# Altium schematic sheet BIAS_control.SchDoc: =MainTitle
size 420 x 297 mm; SheetNumber: 10; SheetTotal: 11; EDA_Number: ARTIQ; Projet: ARTIQ/SINARA; ModifiedBy: -; CreateDate: XX/XX/XXXX; CheckedDate: -; Title2: Power Stage; DivGrp: ISE; Designer: shanasz
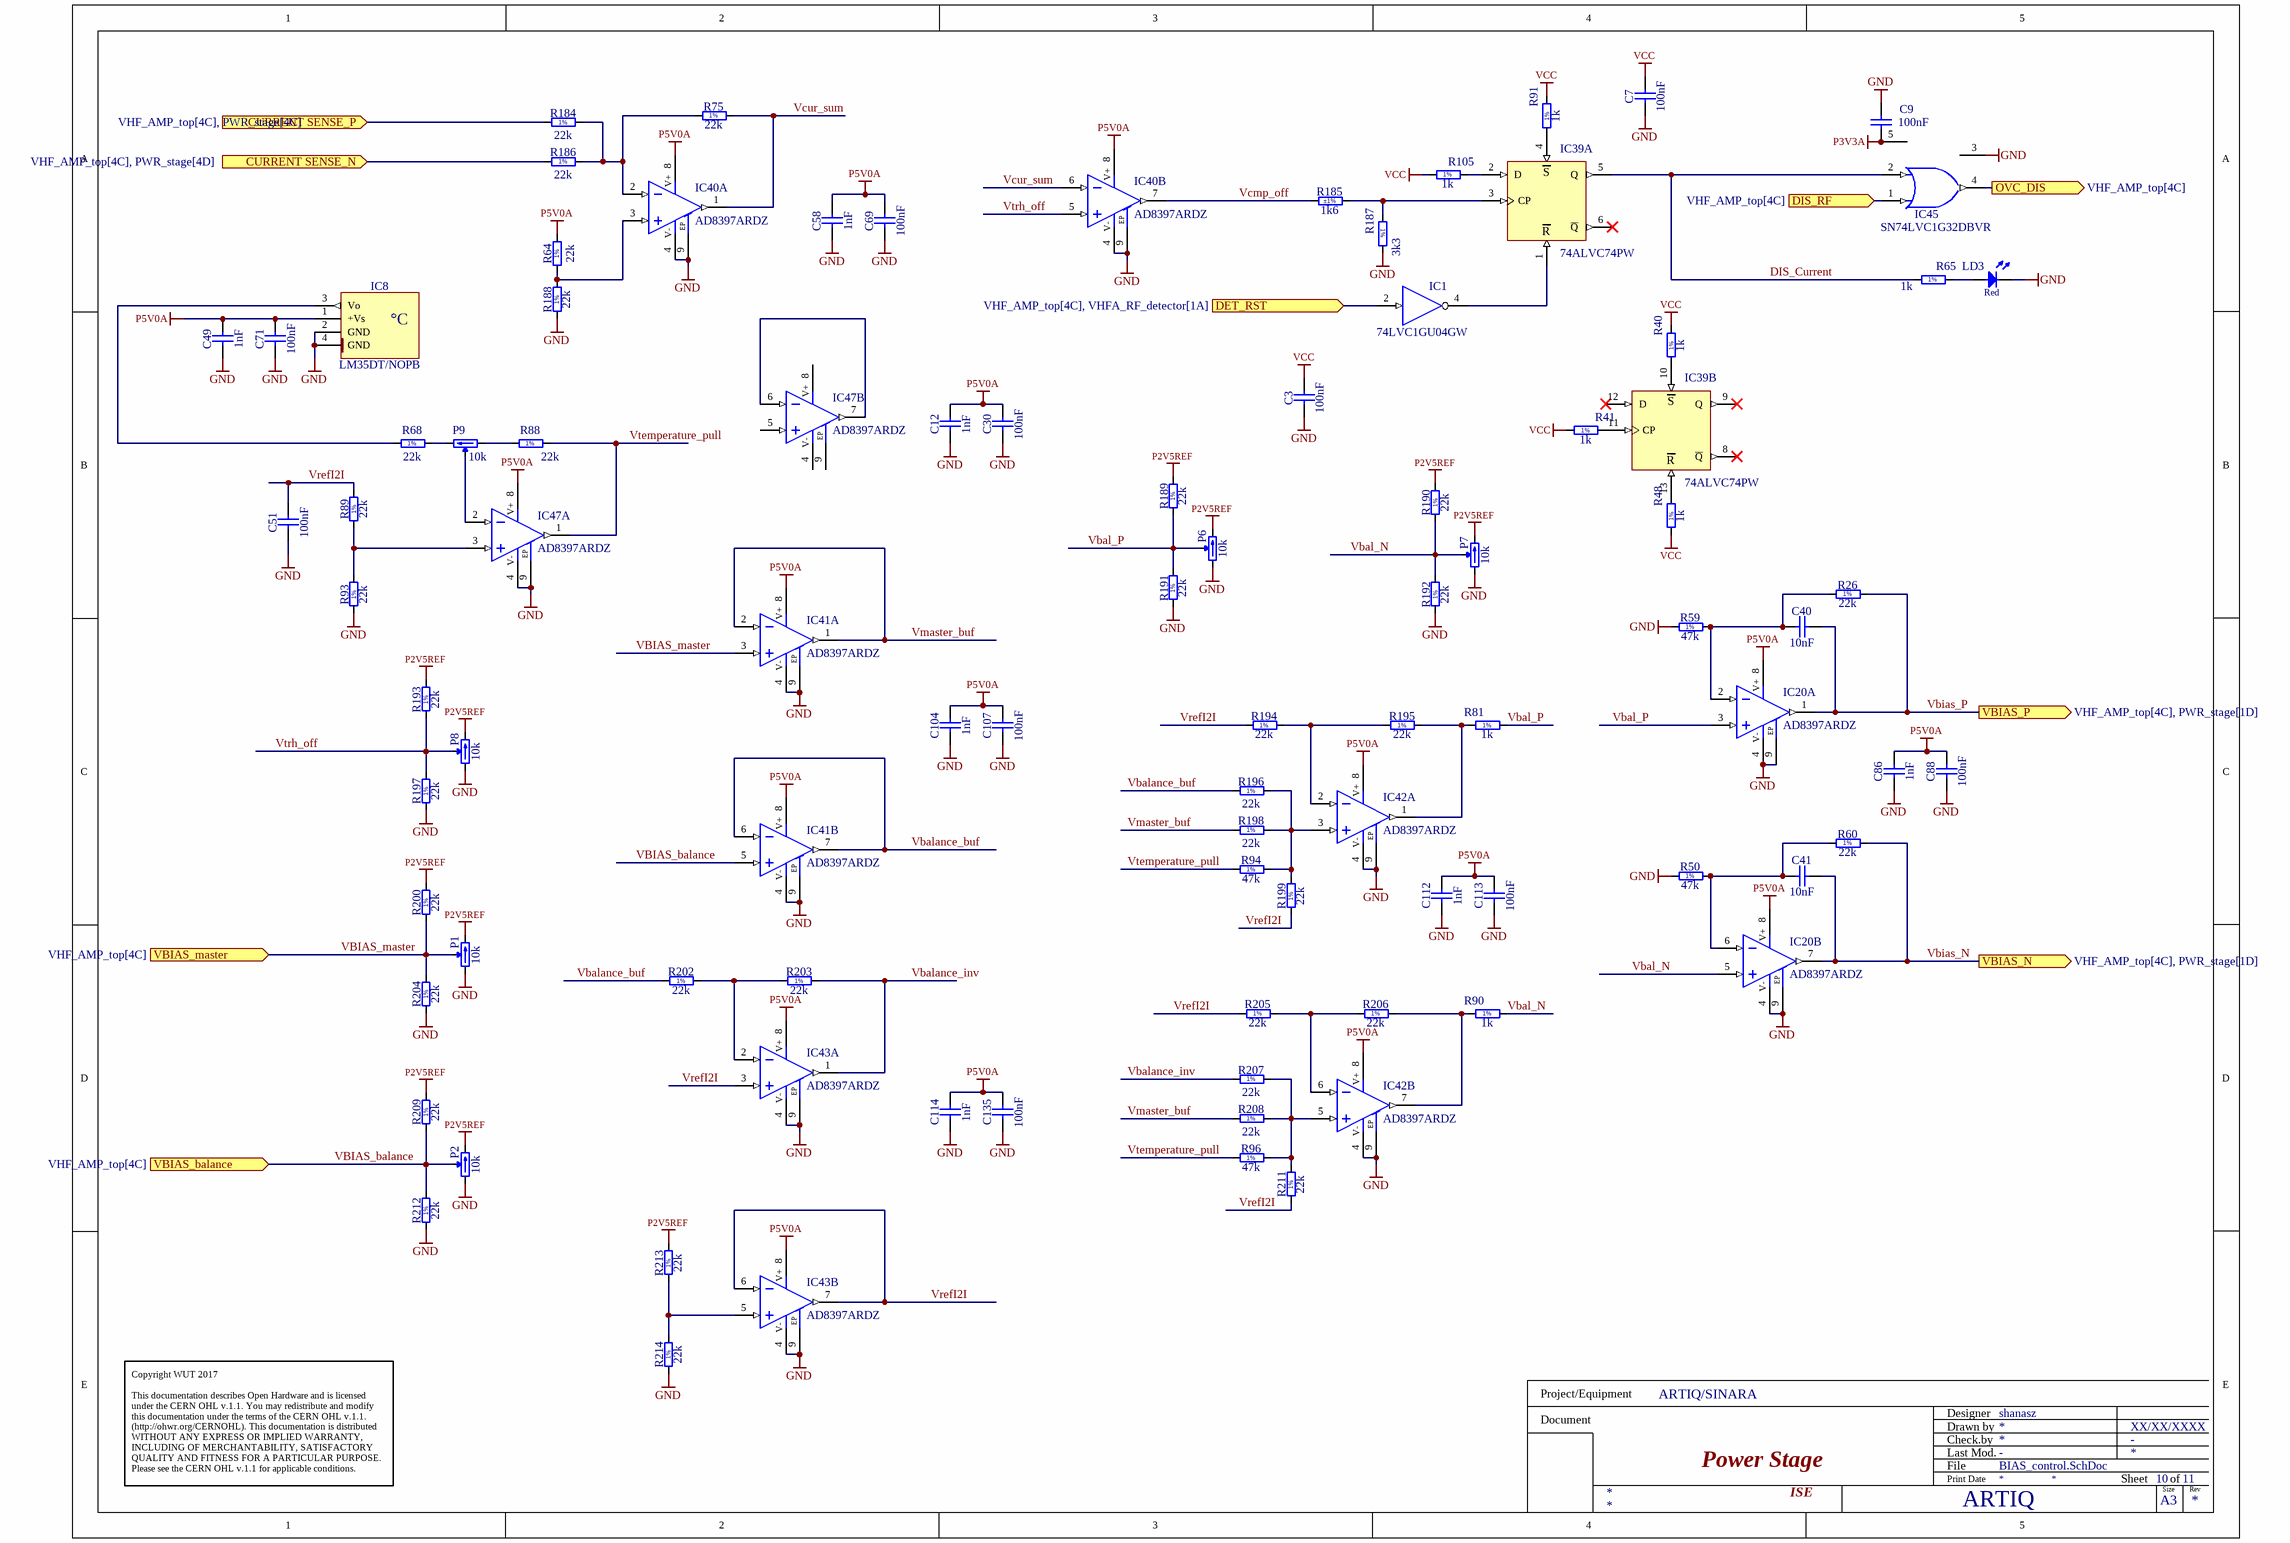
[diagram p0: BIAS_control.SchDoc]

## Parts
C3  100nF  [CAPC1005X55N]
C7  100nF  [CAPC1005X55N]
C9  100nF  [CAPC1005X55N]
C12  1nF  [CAPC1005X55N]
C30  100nF  [CAPC1005X55N]
C40  10nF  [CAPC1005X55N]
C41  10nF  [CAPC1005X55N]
C49  1nF  [CAPC1005X55N]
C51  100nF  [CAPC1005X55N]
C58  1nF  [CAPC1005X55N]
C69  100nF  [CAPC1005X55N]
C71  100nF  [CAPC1005X55N]
C86  1nF  [CAPC1005X55N]
C88  100nF  [CAPC1005X55N]
C104  1nF  [CAPC1005X55N]
C107  100nF  [CAPC1005X55N]
C112  1nF  [CAPC1005X55N]
C113  100nF  [CAPC1005X55N]
C114  1nF  [CAPC1005X55N]
C135  100nF  [CAPC1005X55N]
IC1  74LVC1GU04GW  [SOT65P212X110-5N]
IC8  LM35DT/NOPB  [TO-220-HFLIP]
IC20  AD8397ARDZ  [SOIC127P600X175-9N-R241X309]  (parts A,B of 2)
IC39  74ALVC74PW  [SOP65P640X110-14N]  (parts A,B of 2)
IC40  AD8397ARDZ  [SOIC127P600X175-9N-R241X309]  (parts A,B of 2)
IC41  AD8397ARDZ  [SOIC127P600X175-9N-R241X309]  (parts A,B of 2)
IC42  AD8397ARDZ  [SOIC127P600X175-9N-R241X309]  (parts A,B of 2)
IC43  AD8397ARDZ  [SOIC127P600X175-9N-R241X309]  (parts A,B of 2)
IC45  SN74LVC1G32DBVR  [SOT95P280X145-5N]
IC47  AD8397ARDZ  [SOIC127P600X175-9N-R241X309]  (parts A,B of 2)
LD3  Red  [LED_AVAGO_HSMC-C120]
P1  10k  [TRIM_BOURNS_3224W]
P2  10k  [TRIM_BOURNS_3224W]
P6  10k  [TRIM_BOURNS_3224W]
P7  10k  [TRIM_BOURNS_3224W]
P8  10k  [TRIM_BOURNS_3224W]
P9  10k  [TRIM_BOURNS_3224W]
R26  22k  [RESC1005X40N]
R40  1k  [RESC1005X40N]
R41  1k  [RESC1005X40N]
R48  1k  [RESC1005X40N]
R50  47k  [RESC1005X40N]
R59  47k  [RESC1005X40N]
R60  22k  [RESC1005X40N]
R64  22k  [RESC1005X40N]
R65  1k  [RESC1005X40N]
R68  22k  [RESC1005X40N]
R75  22k  [RESC1005X40N]
R81  1k  [RESC1005X40N]
R88  22k  [RESC1005X40N]
R89  22k  [RESC1005X40N]
R90  1k  [RESC1005X40N]
R91  1k  [RESC1005X40N]
R93  22k  [RESC1005X40N]
R94  47k  [RESC1005X40N]
R96  47k  [RESC1005X40N]
R105  1k  [RESC1005X40N]
R184  22k  [RESC1005X40N]
R185  1k6  Tolerance: ±1%  [RESC1005X40N]
R186  22k  [RESC1005X40N]
R187  3k3  [RESC1005X40N]
R188  22k  [RESC1005X40N]
R189  22k  [RESC1005X40N]
R190  22k  [RESC1005X40N]
R191  22k  [RESC1005X40N]
R192  22k  [RESC1005X40N]
R193  22k  [RESC1005X40N]
R194  22k  [RESC1005X40N]
R195  22k  [RESC1005X40N]
R196  22k  [RESC1005X40N]
R197  22k  [RESC1005X40N]
R198  22k  [RESC1005X40N]
R199  22k  [RESC1005X40N]
R200  22k  [RESC1005X40N]
R202  22k  [RESC1005X40N]
R203  22k  [RESC1005X40N]
R204  22k  [RESC1005X40N]
R205  22k  [RESC1005X40N]
R206  22k  [RESC1005X40N]
R207  22k  [RESC1005X40N]
R208  22k  [RESC1005X40N]
R209  22k  [RESC1005X40N]
R211  22k  [RESC1005X40N]
R212  22k  [RESC1005X40N]
R213  22k  [RESC1005X40N]
R214  22k  [RESC1005X40N]

## Ports
CURRENT SENSE_N (in, see VHF_AMP_top[4C], PWR_stage[4D]), CURRENT SENSE_P (in, see VHF_AMP_top[4C], PWR_stage[4C]), DET_RST (in, see VHF_AMP_top[4C], VHFA_RF_detector[1A]), DIS_RF (in, see VHF_AMP_top[4C]), OVC_DIS (out, see VHF_AMP_top[4C]), VBIAS_balance (in, see VHF_AMP_top[4C]), VBIAS_master (in, see VHF_AMP_top[4C]), VBIAS_N (out, see VHF_AMP_top[4C], PWR_stage[1D]), VBIAS_P (out, see VHF_AMP_top[4C], PWR_stage[1D])

## Nets
GND: C3.1 C7.1 C9.2 C12.1 C30.1 C49.1 C51.1 C58.1 C69.1 C71.1 C86.1 C88.1 C104.1 C107.1 C112.1 C113.1 C114.1 C135.1 IC1.3(GND) IC8.2(GND) IC8.4(GND) IC20.4(V-) IC20.9(Exposed_Pad) IC39.7(GND) IC40.4(V-) IC40.9(Exposed_Pad) IC41.4(V-) IC41.9(Exposed_Pad) IC42.4(V-) IC42.9(Exposed_Pad) IC43.4(V-) IC43.9(Exposed_Pad) IC45.3(GND) IC47.4(V-) IC47.9(Exposed_Pad) LD3.1(C) P1.1(CCW) P2.1(CCW) P6.1(CCW) P7.1(CCW) P8.1(CCW) R50.2 R59.2 R93.2 R187.2 R188.2 R191.2 R192.2 R197.2 R204.2 R212.2 R214.2
P2V5REF: P1.3(CW) P2.3(CW) P6.3(CW) P7.3(CW) P8.3(CW) R189.1 R190.1 R193.1 R200.1 R209.1 R213.1
P3V3A: C9.1 IC45.5(VCC)
P5V0A: C12.2 C30.2 C49.2 C58.2 C69.2 C71.2 C86.2 C88.2 C104.2 C107.2 C112.2 C113.2 C114.2 C135.2 IC8.1(+Vs) IC20.8(V+) IC40.8(V+) IC41.8(V+) IC42.8(V+) IC43.8(V+) IC47.8(V+) R64.1
VCC: C3.2 C7.2 IC39.14(VCC) R40.2 R41.1 R48.1 R91.2 R105.1
VDD: IC1.5(VCC)
CURRENT SENSE_N: R186.2 ; port CURRENT SENSE_N
CURRENT SENSE_P: R184.2 ; port CURRENT SENSE_P
DET_RST: IC1.2(IN) ; port DET_RST
DIS_Current: IC39.5(Q) IC45.2(B) R65.1
DIS_RF: IC45.1(A) ; port DIS_RF
OVC_DIS: IC45.4(Y) ; port OVC_DIS
Vbal_N: IC20.5(IN+) P7.2(W) R90.2 R190.2 R192.1
Vbal_P: IC20.3(IN+) P6.2(W) R81.2 R189.2 R191.1
Vbalance_buf: IC41.6(IN-) IC41.7(OUT) R196.2 R202.2
Vbalance_inv: IC43.1(OUT) R203.1 R207.2
VBIAS_balance: IC41.5(IN+) P2.2(W) R209.2 R212.1 ; port VBIAS_balance
VBIAS_master: IC41.3(IN+) P1.2(W) R200.2 R204.1 ; port VBIAS_master
Vbias_N: C41.2 IC20.7(OUT) R60.1 ; port VBIAS_N
Vbias_P: C40.2 IC20.1(OUT) R26.1 ; port VBIAS_P
Vcmp_off: IC40.7(OUT) R185.1
Vcur_sum: IC40.1(OUT) IC40.6(IN-) R75.1
Vmaster_buf: IC41.1(OUT) IC41.2(IN-) R198.2 R208.2
VrefI2I: C51.2 IC43.3(IN+) IC43.6(IN-) IC43.7(OUT) R89.1 R194.2 R199.2 R205.2 R211.2
Vtemperature_pull: IC47.1(OUT) R88.1 R94.2 R96.2
Vtrh_off: IC40.5(IN+) P8.2(W) R193.2 R197.1
NetC40_1: C40.1 IC20.2(IN-) R26.2 R59.1
NetC41_1: C41.1 IC20.6(IN-) R50.1 R60.2
NetIC1_4: IC1.4(OUT) IC39.1(~{R})
NetIC8_3: IC8.3(Vo) R68.2
NetIC39_2: IC39.2(D) R105.2
NetIC39_3: IC39.3(CP) R185.2 R187.1
NetIC39_4: IC39.4(~{S}) R91.1
NetIC39_10: IC39.10(~{S}) R40.1
NetIC39_11: IC39.11(CP) R41.2
NetIC39_13: IC39.13(~{R}) R48.2
NetIC40_2: IC40.2(IN-) R75.2 R184.1 R186.1
NetIC40_3: IC40.3(IN+) R64.2 R188.1
NetIC42_1: IC42.1(OUT) R81.1 R195.1
NetIC42_2: IC42.2(IN-) R194.1 R195.2
NetIC42_3: IC42.3(IN+) R94.1 R196.1 R198.1 R199.1
NetIC42_5: IC42.5(IN+) R96.1 R207.1 R208.1 R211.1
NetIC42_6: IC42.6(IN-) R205.1 R206.2
NetIC42_7: IC42.7(OUT) R90.1 R206.1
NetIC43_2: IC43.2(IN-) R202.1 R203.2
NetIC43_5: IC43.5(IN+) R213.2 R214.1
NetIC47_2: IC47.2(IN-) P9.2(W)
NetIC47_3: IC47.3(IN+) R89.2 R93.1
NetIC47_6: IC47.6(IN-) IC47.7(OUT)
NetLD3_2: LD3.2(A) R65.2
NetP9_1: P9.1(CCW) R88.2
NetP9_3: P9.3(CW) R68.1

Not connected (* = marked no-connect by the designer): IC39 6(~{Q})* 8(~{Q})* 9(Q)* 12(D)*; IC47 5(IN+)

## Notes on the sheet
- Project/Equipment
- Document
- Designer
- Drawn by
- Check.by
- Copyright WUT 2017
  This documentation describes Open Hardware and is licensed under the CERN OHL v.1.1. You may redistribute and modify this documentation under the terms of the CERN OHL v.1.1. (http://ohwr.org/CERNOHL). This documentation is distributed WITHOUT ANY EXPRESS OR IMPLIED WARRANTY, INCLUDING OF MERCHANTABILITY, SATISFACTORY QUALITY AND FITNESS FOR A PARTICULAR PURPOSE. Please see the CERN OHL v.1.1 for applicable conditions.
- File
- Last Mod.
- Print Date
- Sheet
- Size
- A3
- of
- Rev
- (in symbol 74ALVC74PW, part A) S; R
- (in symbol 74ALVC74PW, part B) S; R
- (in symbol AD8397ARDZ, part A) EP
- (in symbol AD8397ARDZ, part B) EP
- (in symbol LM35DT/NOPB_h) °C
- (in symbol R0402_1K_1%_0.0625W_100PPM) 1%
- (in symbol R0402_3K3_1%_0.0625W_100PPM) 1%
- (in symbol R0402_22K_1%_0.0625W_100PPM) 1%
- (in symbol R0402_47K_1%_0.0625W_100PPM) 1%

## Library data of the parts
C3 C7 C9 C30 C51 C69 C71 C88 C107 C113 C135 = CC0402_100NF_50V_10%_X7R: Non-polarised capacitor; Part Description: SMD Multilayer Chip Ceramic Capacitor; Manufacturer: GENERIC; Manufacturer1 Part Number: GRM155R71H104KE14D; Voltage: 50V; TC: X7R; Tolerance: ±10%; Part Number: CC0402_100NF_50V_10%_X7R; Component Kind: Standard; Component Type: Standard; Pin Count: 2; Value: 100nF; Status: None; Manufacturer Part Number: CC0402_100NF_50V_10%_X7R; Case: 0402; Mounted: Yes; Socket: No; SMD: Yes; Sense: No; Manufacturer1 Example: MURATA; Manufacturer1 ComponentHeight: 0.55mm; HelpURL: \\cern.ch\dfs\Applications\Altium\Datasheets\CC0402_MURATA_GRM155R71H104KE14D.pdf; Author: CERN DEM MR; CreateDate: 30.06.2017; LatestRevisionDate: 30.06.2017
C12 C49 C58 C86 C104 C112 C114 = CC0402_1NF_50V_10%_X7R: Non-polarised capacitor; Part Description: SMD Multilayer Chip Ceramic Capacitor; Manufacturer: GENERIC; Manufacturer1 Part Number: 223858715623; Voltage: 50V; TC: X7R; Tolerance: ±10%; Part Number: CC0402_1NF_50V_10%_X7R; Component Kind: Standard; Component Type: Standard; Pin Count: 2; Value: 1nF; Status: Not Recommended; Manufacturer Part Number: CC0402_1NF_50V_10%_X7R; Case: 0402; Mounted: Yes; Socket: No; SMD: Yes; Sense: No; Manufacturer1 Example: PHYCOMP; Manufacturer1 ComponentHeight: 0.55mm; HelpURL: \\cern.ch\dfs\Applications\Altium\Datasheets\CC0402_X7R_PHYCOMP.pdf; Author: CERN DEM JLC; CreateDate: 03.12.2007; LatestRevisionDate: 03.12.2007
C40 C41 = CC0402_10NF_16V_10%_X7R: Non-polarised capacitor; Manufacturer: GENERIC; Manufacturer1 Part Number: 223878715636; Part Description: SMD Multilayer Chip Ceramic Capacitor; TC: X7R; Tolerance: ±10%; Voltage: 16V; Case: 0402; Manufacturer Part Number: CC0402_10NF_16V_10%_X7R; Manufacturer1 Example: PHYCOMP; Part Number: CC0402_10NF_16V_10%_X7R; Pin Count: 2; SMD: Yes; Status: Not Recommended; Value: 10nF; Component Kind: Standard; Component Type: Standard; Mounted: Yes; Socket: No; Sense: No; Manufacturer1 ComponentHeight: 0.55mm; HelpURL: \\cern.ch\dfs\Applications\Altium\Datasheets\CC0402_X7R_PHYCOMP.pdf; Author: CERN DEM JLC; CreateDate: 03.12.2007; LatestRevisionDate: 03.12.2007
IC1 = 74LVC1GU04GW: Single Inverter Buffer; Manufacturer: NXP SEMICONDUCTORS; PressFit: No; Bonding: No; Part Number: 74LVC1GU04GW; Component Kind: Standard; Component Type: Standard; Device: 74LVC1GU04GW; PackageDescription: SOT353, SOT, 0.65mm Pitch, 5 pin, 1.25mm W X 2.05mm L X 1.10mm H, IPC Medium Density; Part Description: Inverter; Manufacturer Part Number: 74LVC1GU04GW; Pin Count: 3; Case: SOT353; Mounted: Yes; Socket: No; SMD: Yes; Sense: No; ComponentHeight: 1.1mm; Author: CERN DEM JLC; HelpURL: \\cern.ch\dfs\Applications\Altium\Datasheets\74LVC1GU04GW.pdf; CreateDate: 11.01.2011; LatestRevisionDate: 11.01.2011
IC8 = LM35DT/NOPB_h: Precision Centigrade Temperature Sensor; Part Description: 0° to +100°C ±0.6°C Precision Centigrade Temperature Sensor; Manufacturer: TEXAS INSTRUMENTS; PressFit: No; Bonding: No; Part Number: LM35DT/NOPB_h; Component Kind: Standard; Component Type: Standard; Device: LM35DT/NOPB; Footprint: TO-220-h; PackageDescription: TO-220 3-Terminal + Tab - Horizontal Mount; Manufacturer Part Number: LM35DT/NOPB; Pin Count: 4; Case: TO-220; Mounted: Yes; Socket: No; SMD: No; Sense: No; ComponentHeight: 19.55mm; HelpURL: \\cern.ch\dfs\Applications\Altium\Datasheets\LM35DT-NOPB.pdf; Author: CERN DEM JLC; CreateDate: 17.06.2013; LatestRevisionDate: 17.06.2013
IC20 IC40-IC43 IC47 = AD8397ARDZ: Dual Operational Amplifier With Exposed Pad; Part Description: Rail-to-Rail, High Output Current Amplifier; Manufacturer: ANALOG DEVICES; PressFit: No; Bonding: No; Part Number: AD8397ARDZ; Component Kind: Standard; Component Type: Standard; Device: AD8397ARDZ; PackageDescription: SOIC 8, Pitch 1.27mm - Body 3.9x4.9mm, (w/thermal tab 2.41mm X 3.098mm), IPC Medium Density; Manufacturer Part Number: AD8397ARDZ; Pin Count: 9; Case: SOIC8; Mounted: Yes; Socket: No; SMD: Yes; Sense: No; ComponentHeight: 1.75mm; Author: CERN DEM JLC; HelpURL: \\cern.ch\dfs\Applications\Altium\Datasheets\AD8397ARDZ.pdf; CreateDate: 31.05.2011; LatestRevisionDate: 31.05.2011
IC39 = 74ALVC74PW: Dual D-Type Flip Flop with Preset and Clear; Part Description: Dual D-Type Flip-Flop with Set and Reset, Positive-Edge Trigger; Manufacturer: NXP SEMICONDUCTORS; PressFit: No; Bonding: No; Part Number: 74ALVC74PW; Component Kind: Standard; Component Type: Standard; Device: 74ALVC74PW; PackageDescription: SOP, 14-Leads, Body 4.4x5mm (max), Pitch 0.65mm, IPC Medium Density; Manufacturer Part Number: 74ALVC74PW; Pin Count: 12; Case: TSSOP14; Mounted: Yes; Socket: No; SMD: Yes; Sense: No; ComponentHeight: 1.1mm; Author: CERN DEM JLC; HelpURL: \\cern.ch\dfs\Applications\Altium\Datasheets\74ALVC74PW.pdf; CreateDate: 08.12.2014; LatestRevisionDate: 08.12.2014
IC45 = SN74LVC1G32DBVR: Single 2-Input Positive-OR Gate; Manufacturer: TEXAS INSTRUMENTS; PressFit: No; Bonding: No; Part Number: SN74LVC1G32DBVR; Component Kind: Standard; Component Type: Standard; Device: SN74LVC1G32DBVR; PackageDescription: SOT, 0.95mm Pitch; 5 Pin, 1.60mm W X 2.90mm L X 1.45mm H body, IPC Medium Density; Part Description: Single 2-Input Positive-OR Gate; Manufacturer Part Number: SN74LVC1G32DBVR; Pin Count: 5; Case: SOT23-5; Mounted: Yes; Socket: No; SMD: Yes; Sense: No; ComponentHeight: 1.45mm; Author: CERN DEM JLC; HelpURL: \\cern.ch\dfs\Applications\Altium\Datasheets\SN74LVC1G32DBVR.pdf; CreateDate: 25.04.2012; LatestRevisionDate: 25.04.2012
LD3 = LED_AVAGO_HSMC-C120: LED Red 1C 2A; Part Description: High Performance Right Angle Chip Red LED; Manufacturer: AVAGO TECHNOLOGIES; PressFit: No; Bonding: No; Part Number: LED_AVAGO_HSMC-C120; Component Kind: Standard; Component Type: Standard; Color: Red; PackageDescription: Red Chip LED, 2-Leads, Body 1.7x1.1mm, Side Emitting Package; Manufacturer Part Number: HSMC-C120; Pin Count: 2; Mounted: Yes; Socket: No; SMD: Yes; Sense: No; ComponentHeight: 0.7mm; HelpURL: \\cern.ch\dfs\Applications\Altium\Datasheets\LED_AVAGO_HSMC-C120.pdf; ComponentLink1URL: \\cern.ch\dfs\Applications\Altium\Datasheets\LED_AVAGO_HSMC-C120_DESIGN-GUIDE.pdf; ComponentLink1Description: Design Guide; Author: CERN DEM JMW; CreateDate: 22.07.2009; LatestRevisionDate: 20.06.2012
P1 P2 P6-P9 = TRIM_12T_10K_BOURNS_3224W-1-103E: Trimming Potentiometer; Part Description: 12 Turns SMD Trimpot® Trimming Potentiometer (Top Adjust); Manufacturer: BOURNS; Power: 0.25W; TC: ±100ppm/°C; Tolerance: ±10%; PressFit: No; Part Number: TRIM_12T_10K_BOURNS_3224W-1-103E; Component Kind: Standard; Component Type: Standard; Pin Count: 3; Value: 10k; Manufacturer Part Number: 3224W-1-103E; Case: 3224W; Mounted: Yes; Socket: No; SMD: Yes; Sense: No; ComponentHeight: 5.3mm; HelpURL: \\cern.ch\dfs\Applications\Altium\Datasheets\TRIM_BOURNS_3224W.pdf; Author: CERN DEM JLC; CreateDate: 18.12.2012; LatestRevisionDate: 18.12.2012
R26 R60 R64 R68 R75 R88 R89 R93 R184 R186 R188-R200 R202-R209 R211-R214 = R0402_22K_1%_0.0625W_100PPM: Resistor - 1%; Part Description: General Purpose Thick Film Chip Resistor; Manufacturer: GENERIC; Manufacturer1 Part Number: 232270672203L; TC: ±100ppm/°C; PressFit: No; Part Number: R0402_22K_1%_0.0625W_100PPM; Component Kind: Standard; Component Type: Standard; Pin Count: 2; Value: 22k; Status: Not Recommended; Power: 0.0625W; Tolerance: ±1%; Manufacturer Part Number: R0402_22K_1%_0.0625W_100PPM; Case: 0402; Mounted: Yes; Sense: No; Socket: No; SMD: Yes; Manufacturer1 Example: YAGEO PHYCOMP; Manufacturer1 ComponentHeight: 0.4mm; HelpURL: \\cern.ch\dfs\Applications\Altium\Datasheets\R0402_Phycomp_RC0402.pdf; Author: CERN DEM JLC; CreateDate: 03.12.2007; LatestRevisionDate: 17.10.2012
R40 R41 R48 R81 R90 R91 R105 = R0402_1K_1%_0.0625W_100PPM: Resistor - 1%; Part Description: General Purpose Thick Film Chip Resistor; Manufacturer: GENERIC; Manufacturer1 Part Number: 232270671002L; TC: ±100ppm/°C; PressFit: No; Part Number: R0402_1K_1%_0.0625W_100PPM; Component Kind: Standard; Component Type: Standard; Pin Count: 2; Value: 1k; Status: Not Recommended; Power: 0.0625W; Tolerance: ±1%; Manufacturer Part Number: R0402_1K_1%_0.0625W_100PPM; Case: 0402; Mounted: Yes; Sense: No; Socket: No; SMD: Yes; Manufacturer1 Example: YAGEO PHYCOMP; Manufacturer1 ComponentHeight: 0.4mm; HelpURL: \\cern.ch\dfs\Applications\Altium\Datasheets\R0402_Phycomp_RC0402.pdf; Author: CERN DEM JLC; CreateDate: 03.12.2007; LatestRevisionDate: 17.10.2012
R50 R59 R94 R96 = R0402_47K_1%_0.0625W_100PPM: Resistor - 1%; Part Description: General Purpose Thick Film Chip Resistor; Manufacturer: GENERIC; Manufacturer1 Part Number: 232270675103L; TC: ±100ppm/°C; PressFit: No; Part Number: R0402_47K_1%_0.0625W_100PPM; Component Kind: Standard; Component Type: Standard; Pin Count: 2; Value: 47k; Status: Not Recommended; Power: 0.0625W; Tolerance: ±1%; Manufacturer Part Number: R0402_47K_1%_0.0625W_100PPM; Case: 0402; Mounted: Yes; Sense: No; Socket: No; SMD: Yes; Manufacturer1 Example: YAGEO PHYCOMP; Manufacturer1 ComponentHeight: 0.4mm; HelpURL: \\cern.ch\dfs\Applications\Altium\Datasheets\R0402_Phycomp_RC0402.pdf; Author: CERN DEM JLC; CreateDate: 03.12.2007; LatestRevisionDate: 17.10.2012
R65 = R0402_1K_1%_0.0625W_100PPM: Resistor - 1%; Manufacturer: GENERIC; Part Description: General Purpose Thick Film Chip Resistor; Manufacturer1 Part Number: 232270671002L; TC: ±100ppm/°C; PressFit: No; Value: 1k; Manufacturer Part Number: R0402_1K_1%_0.0625W_100PPM; Part Number: R0402_1K_1%_0.0625W_100PPM; Component Kind: Standard; Component Type: Standard; Pin Count: 2; Status: Not Recommended; Power: 0.0625W; Tolerance: ±1%; Case: 0402; Mounted: Yes; Sense: No; Socket: No; SMD: Yes; Manufacturer1 Example: YAGEO PHYCOMP; Manufacturer1 ComponentHeight: 0.4mm; HelpURL: \\cern.ch\dfs\Applications\Altium\Datasheets\R0402_Phycomp_RC0402.pdf; Author: CERN DEM JLC; CreateDate: 03.12.2007; LatestRevisionDate: 17.10.2012
R185 = R0402_1K6_1%_0.0625W_100PPM: Resistor - 1%; Part Description: General Purpose Thick Film Chip Resistor; Manufacturer: GENERIC; Manufacturer1 Part Number: 232270671602L; TC: ±100ppm/°C; PressFit: No; Part Number: R0402_1K6_1%_0.0625W_100PPM; Component Kind: Standard; Component Type: Standard; Pin Count: 2; Value: 1k6; Status: Not Recommended; Power: 0.0625W; Manufacturer Part Number: R0402_1K6_1%_0.0625W_100PPM; Case: 0402; Mounted: Yes; Sense: No; Socket: No; SMD: Yes; Manufacturer1 Example: YAGEO PHYCOMP; Manufacturer1 ComponentHeight: 0.4mm; HelpURL: \\cern.ch\dfs\Applications\Altium\Datasheets\R0402_Phycomp_RC0402.pdf; Author: CERN DEM JLC; CreateDate: 2007-12-03; LatestRevisionDate: 2012-10-17
R187 = R0402_3K3_1%_0.0625W_100PPM: Resistor - 1%; Part Description: General Purpose Thick Film Chip Resistor; Manufacturer: GENERIC; Manufacturer1 Part Number: 232270673302L; TC: ±100ppm/°C; PressFit: No; Part Number: R0402_3K3_1%_0.0625W_100PPM; Component Kind: Standard; Component Type: Standard; Pin Count: 2; Value: 3k3; Status: Not Recommended; Power: 0.0625W; Tolerance: ±1%; Manufacturer Part Number: R0402_3K3_1%_0.0625W_100PPM; Case: 0402; Mounted: Yes; Sense: No; Socket: No; SMD: Yes; Manufacturer1 Example: YAGEO PHYCOMP; Manufacturer1 ComponentHeight: 0.4mm; HelpURL: \\cern.ch\dfs\Applications\Altium\Datasheets\R0402_Phycomp_RC0402.pdf; Author: CERN DEM JLC; CreateDate: 03.12.2007; LatestRevisionDate: 17.10.2012